# Altium schematic sheet M.2_SATA_SLOT.schdoc
size 420 x 298 mm; Symbol: Sheet-Symbol_A3; Company: 嘉立创EDA; Version: V1.0; Page Size: A3; @Project Name: 【全网首发】X86电脑主板_copy; @Page Count: 18; @Update Date: 2025-10-09; @Create Date: 2025-10-09; @Schematic Name: SCHEMATIC1_1; @Page No: 0; @Page Name: M.2_SATA_SLOT; Device: Sheet-Symbol_A3
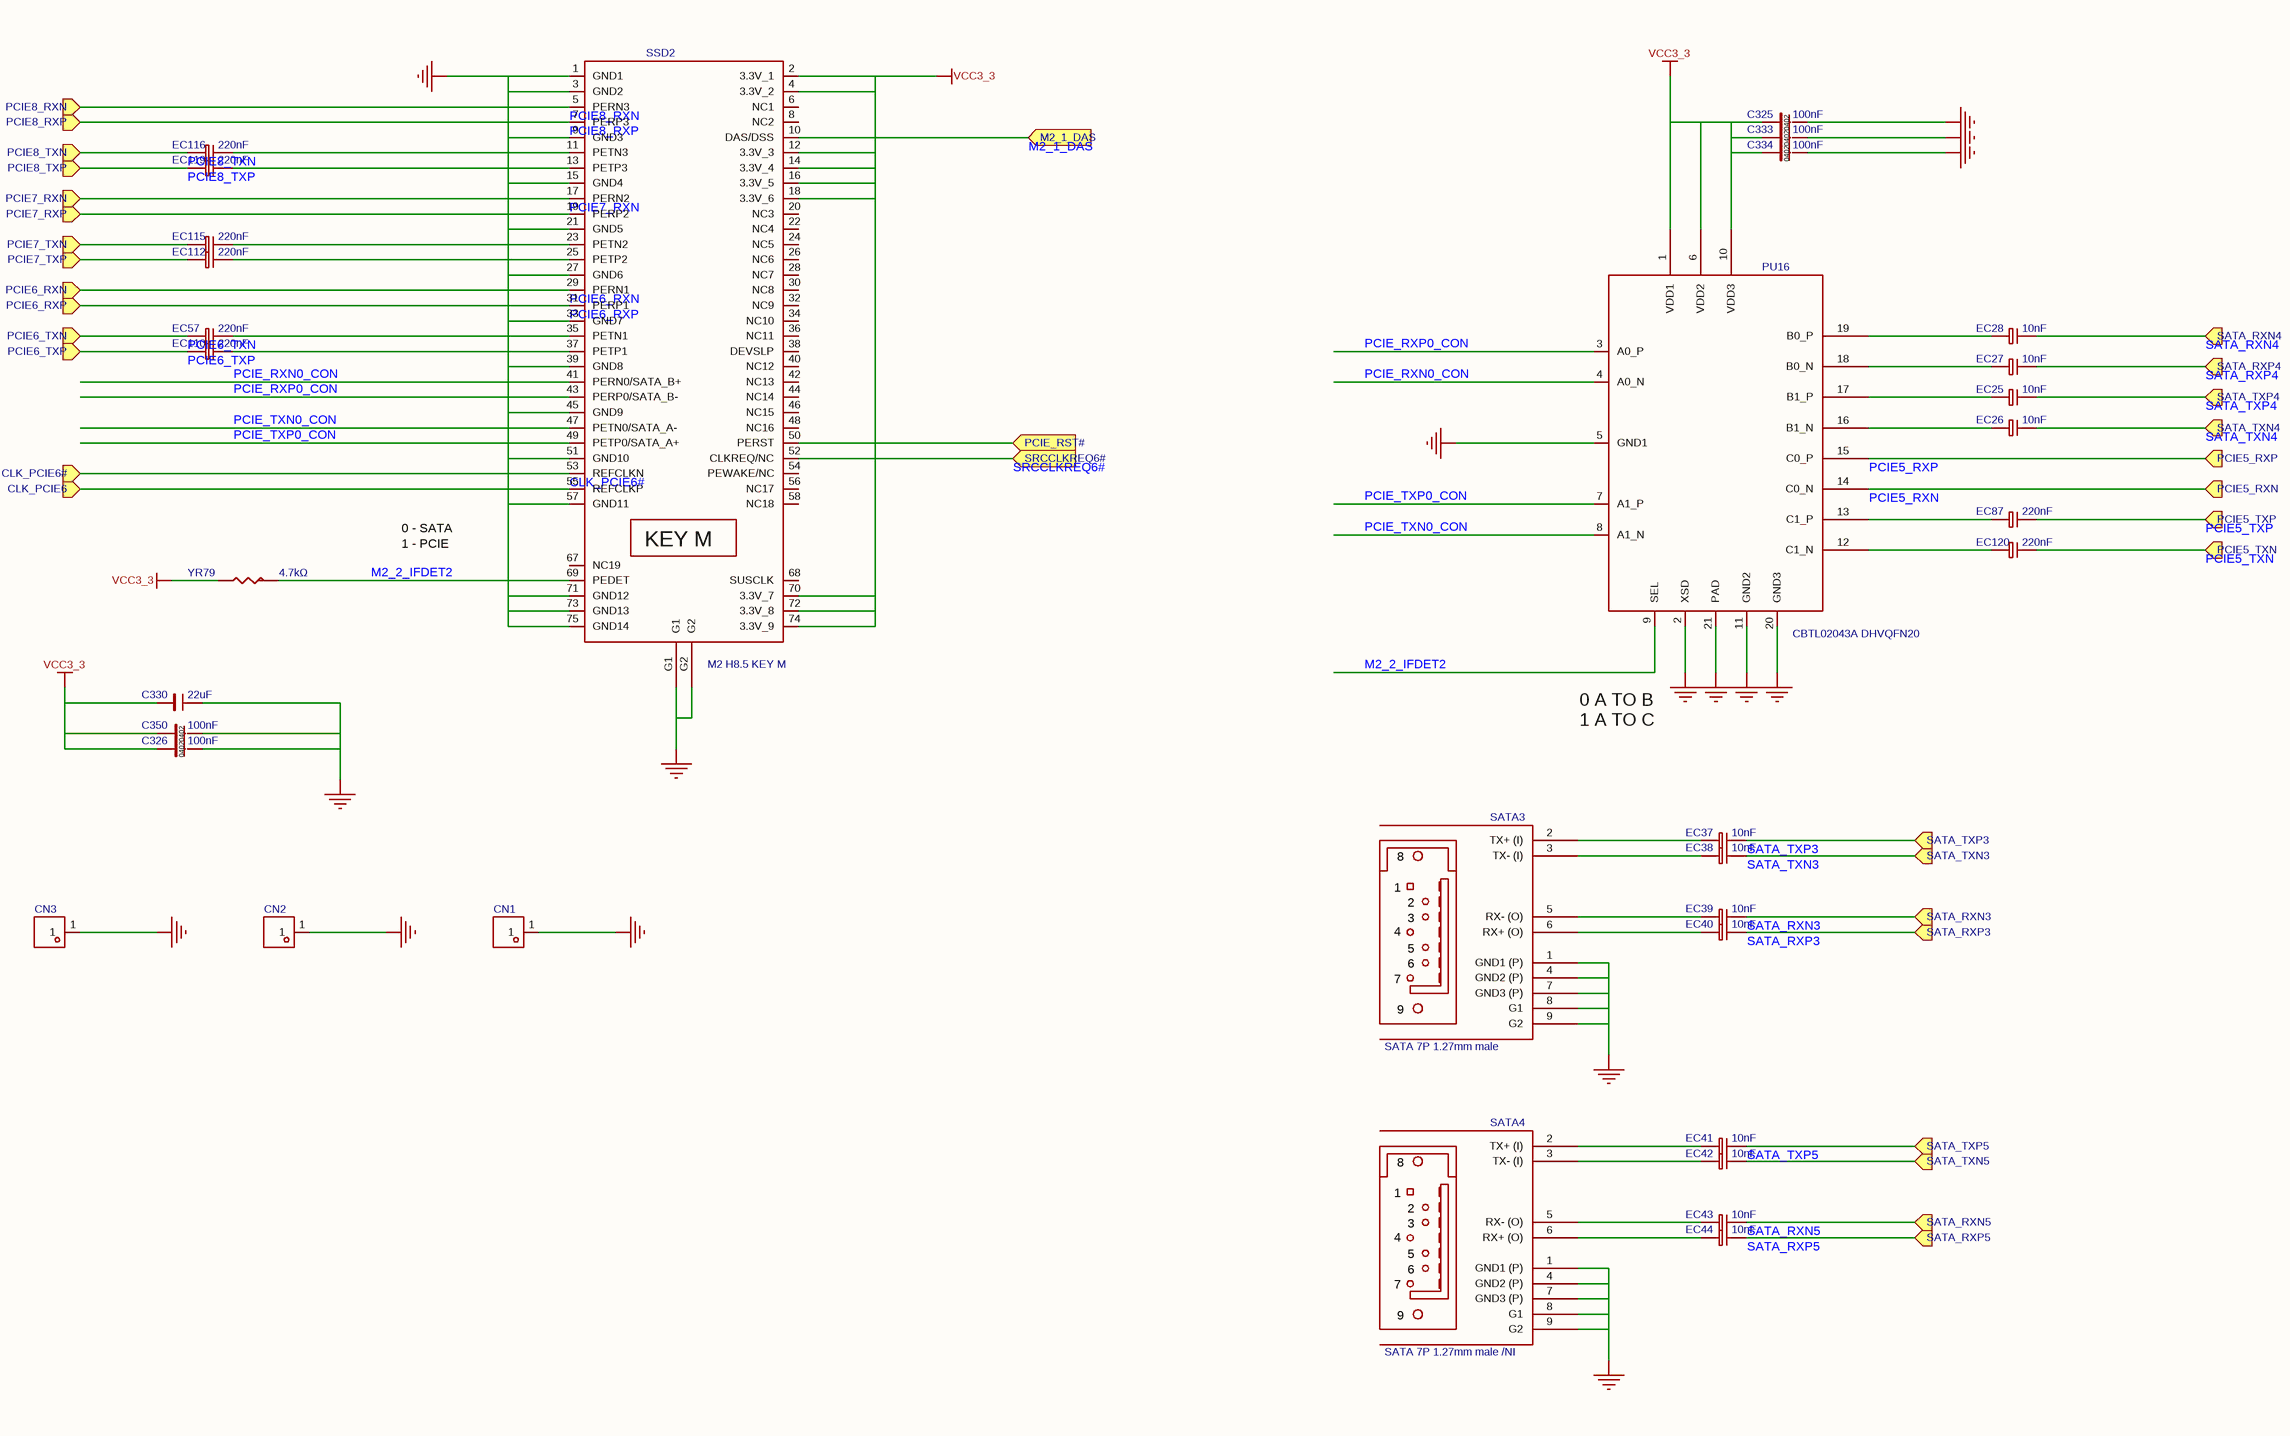
[diagram p0: M.2_SATA_SLOT.schdoc]

## Parts
C325  100nF  [C0402_1]
C326  100nF  [C0402_2]
C330  22uF  [C0603_3]
C333  100nF  [C0402_3]
C334  100nF  [C0402]
C350  100nF  [C0402_2]
CN1  SMTSOM270BTR  [SMD_BD5.6-D3.6]  (value not drawn)
CN2  SMTSOM270BTR  [SMD_BD5.6-D3.6]  (value not drawn)
CN3  SMTSOM270BTR  [SMD_BD5.6-D3.6]  (value not drawn)
EC25  10nF  [C0402_1]
EC26  10nF  [C0402_1]
EC27  10nF  [C0402_1]
EC28  10nF  [C0402_1]
EC37  10nF  [C0402_2]
EC38  10nF  [C0402_2]
EC39  10nF  [C0402_2]
EC40  10nF  [C0402_2]
EC41  10nF  [C0402_2]
EC42  10nF  [C0402_2]
EC43  10nF  [C0402_2]
EC44  10nF  [C0402_2]
EC57  220nF  [C0402_2]
EC87  220nF  [C0402_1]
EC110  220nF  [C0402_2]
EC112  220nF  [C0402_2]
EC115  220nF  [C0402_2]
EC116  220nF  [C0402_2]
EC119  220nF  [C0402_2]
EC120  220nF  [C0402_1]
PU16  value CBTL02043A DHVQFN20  [DHVQFN20]  (hidden comment: CBTL02043ABQ,115)
SATA3  value SATA 7P 1.27mm male  [SATA_D_AKL]  (hidden comment: LE18077-Z54D-4H)
SATA4  value SATA 7P 1.27mm male /NI  [SATA_D_AKL]  (hidden comment: LE18077-Z54D-4H)
SSD2  value M2 H8.5 KEY M  [SMD-NGFF-75P-M2-H3-LOTES]  (hidden comment: 91302-67-067R2M)
YR79  4.7kΩ  [R0402]

## Ports
CLK_PCIE6 (in), CLK_PCIE6# (in), M2_1_DAS (in), PCIE5_RXN (in), PCIE5_RXP (in), PCIE5_TXN (in), PCIE5_TXP (in), PCIE6_RXN (in), PCIE6_RXP (in), PCIE6_TXN (in), PCIE6_TXP (in), PCIE7_RXN (in), PCIE7_RXP (in), PCIE7_TXN (in), PCIE7_TXP (in), PCIE8_RXN (in), PCIE8_RXP (in), PCIE8_TXN (in), PCIE8_TXP (in), PCIE_RST# (in), SATA_RXN3 (in), SATA_RXN4 (in), SATA_RXN5 (in), SATA_RXP3 (in), SATA_RXP4 (in), SATA_RXP5 (in), SATA_TXN3 (in), SATA_TXN4 (in), SATA_TXN5 (in), SATA_TXP3 (in), SATA_TXP4 (in), SATA_TXP5 (in), SRCCLKREQ6# (in)

## Nets
GND: C325.2 C326.2 C330.2 C333.2 C334.2 C350.2 CN1.1 CN2.1 CN3.1 PU16.2(XSD) PU16.5(GND1) PU16.11(GND2) PU16.20(GND3) PU16.21(PAD) SATA3.1(GND1_(P)) SATA3.4(GND2_(P)) SATA3.7(GND3_(P)) SATA3.8(G1) SATA3.9(G2) SATA4.1(GND1_(P)) SATA4.4(GND2_(P)) SATA4.7(GND3_(P)) SATA4.8(G1) SATA4.9(G2) SSD2.1(GND1) SSD2.3(GND2) SSD2.9(GND3) SSD2.15(GND4) SSD2.21(GND5) SSD2.27(GND6) SSD2.33(GND7) SSD2.39(GND8) SSD2.45(GND9) SSD2.51(GND10) SSD2.57(GND11) SSD2.71(GND12) SSD2.73(GND13) SSD2.75(GND14) SSD2.G1 SSD2.G2
VCC3_3: C325.1 C326.1 C330.1 C333.1 C334.1 C350.1 PU16.1(VDD1) PU16.6(VDD2) PU16.10(VDD3) SSD2.2(3.3V_1) SSD2.4(3.3V_2) SSD2.12(3.3V_3) SSD2.14(3.3V_4) SSD2.16(3.3V_5) SSD2.18(3.3V_6) SSD2.70(3.3V_7) SSD2.72(3.3V_8) SSD2.74(3.3V_9) YR79.2
CLK_PCIE6: SSD2.55(REFCLKP) ; port CLK_PCIE6
CLK_PCIE6#: SSD2.53(REFCLKN) ; port CLK_PCIE6#
M2_1_DAS: SSD2.10(DAS/DSS) ; port M2_1_DAS
M2_2_IFDET2: PU16.9(SEL) SSD2.69(PEDET) YR79.1
PCIE5_RXN: PU16.14(C0_N) ; port PCIE5_RXN
PCIE5_RXP: PU16.15(C0_P) ; port PCIE5_RXP
PCIE5_TXN: EC120.2 ; port PCIE5_TXN
PCIE5_TXP: EC87.2 ; port PCIE5_TXP
PCIE6_RXN: SSD2.29(PERN1) ; port PCIE6_RXN
PCIE6_RXP: SSD2.31(PERP1) ; port PCIE6_RXP
PCIE6_TXN: EC57.1 ; port PCIE6_TXN
PCIE6_TXP: EC110.1 ; port PCIE6_TXP
PCIE7_RXN: SSD2.17(PERN2) ; port PCIE7_RXN
PCIE7_RXP: SSD2.19(PERP2) ; port PCIE7_RXP
PCIE7_TXN: EC115.1 ; port PCIE7_TXN
PCIE7_TXP: EC112.1 ; port PCIE7_TXP
PCIE8_RXN: SSD2.5(PERN3) ; port PCIE8_RXN
PCIE8_RXP: SSD2.7(PERP3) ; port PCIE8_RXP
PCIE8_TXN: EC116.1 ; port PCIE8_TXN
PCIE8_TXP: EC119.1 ; port PCIE8_TXP
PCIE_RST#: SSD2.50(PERST) ; port PCIE_RST#
PCIE_RXN0_CON: PU16.4(A0_N) SSD2.41(PERN0/SATA_B+)
PCIE_RXP0_CON: PU16.3(A0_P) SSD2.43(PERP0/SATA_B-)
PCIE_TXN0_CON: PU16.8(A1_N) SSD2.47(PETN0/SATA_A-)
PCIE_TXP0_CON: PU16.7(A1_P) SSD2.49(PETP0/SATA_A+)
SATA_RXN3: EC39.2 ; port SATA_RXN3
SATA_RXN4: EC28.2 ; port SATA_RXN4
SATA_RXN5: EC43.2 ; port SATA_RXN5
SATA_RXP3: EC40.2 ; port SATA_RXP3
SATA_RXP4: EC27.2 ; port SATA_RXP4
SATA_RXP5: EC44.2 ; port SATA_RXP5
SATA_TXN3: EC38.2 ; port SATA_TXN3
SATA_TXN4: EC26.2 ; port SATA_TXN4
SATA_TXN5: EC42.2 ; port SATA_TXN5
SATA_TXP3: EC37.2 ; port SATA_TXP3
SATA_TXP4: EC25.2 ; port SATA_TXP4
SATA_TXP5: EC41.2 ; port SATA_TXP5
SRCCLKREQ6#: SSD2.52(CLKREQ/NC) ; port SRCCLKREQ6#
NetEC25_1: EC25.1 PU16.17(B1_P)
NetEC26_1: EC26.1 PU16.16(B1_N)
NetEC27_1: EC27.1 PU16.18(B0_N)
NetEC28_1: EC28.1 PU16.19(B0_P)
NetEC37_1: EC37.1 SATA3.2(TX+_(I))
NetEC38_1: EC38.1 SATA3.3(TX-_(I))
NetEC39_1: EC39.1 SATA3.5(RX-_(O))
NetEC40_1: EC40.1 SATA3.6(RX+_(O))
NetEC41_1: EC41.1 SATA4.2(TX+_(I))
NetEC42_1: EC42.1 SATA4.3(TX-_(I))
NetEC43_1: EC43.1 SATA4.5(RX-_(O))
NetEC44_1: EC44.1 SATA4.6(RX+_(O))
NetEC57_2: EC57.2 SSD2.35(PETN1)
NetEC87_1: EC87.1 PU16.13(C1_P)
NetEC110_2: EC110.2 SSD2.37(PETP1)
NetEC112_2: EC112.2 SSD2.25(PETP2)
NetEC115_2: EC115.2 SSD2.23(PETN2)
NetEC116_2: EC116.2 SSD2.11(PETN3)
NetEC119_2: EC119.2 SSD2.13(PETP3)
NetEC120_1: EC120.1 PU16.12(C1_N)

Not connected (* = marked no-connect by the designer): SSD2 6(NC1) 8(NC2) 20(NC3) 22(NC4) 24(NC5) 26(NC6) 28(NC7) 30(NC8) 32(NC9) 34(NC10) 36(NC11) 38(DEVSLP) 40(NC12) 42(NC13) 44(NC14) 46(NC15) 48(NC16) 54(PEWAKE/NC) 56(NC17) 58(NC18) 67(NC19) 68(SUSCLK)

## Notes on the sheet
- 0 - SATA
- 1 - PCIE
- (near EC37) 0 A TO B
  1 A TO C
- 更新日期
- 2025-10-09
- 原理图
- 图页
- 创建日期
- 物料编码
- 审阅
- 绘制
- 【全网首发】X86电脑主板_copy
- 版本
- V1.0
- 尺寸
- A3
- 页
- 0
- 嘉立创EDA
- 共
- 18
- (in symbol 91302-67-067R2M) KEY M

## Library data of the parts
C325 C326 C333 C350 = CL05B104KO5NNNC: 容值:100nF;精度:±10%;额定电压:16V;材质(温度系数):X7R;; Manufacturer: SAMSUNG(三星); Symbol: C0402; ModelId: 36a51122f27c49738f86b3bfa98863e0; Tolerance: ±10%; AddInBom: yes; Voltage Rated: 16V; ModelName: C0402_L1.0-W0.5-H0.5; ModelTransform: 39.37,19.685,0,0,0,0,0,0,0; Temperature Coefficient: X7R; Device: CL05B104KO5NNNC; Value: 100nF; Supplier: LCSC; Datasheet: https://atta.szlcsc.com/upload/public/pdf/source/20160103/1457707674891.pdf; SupplierPart: C1525; ConvertToPcb: yes; LCSC Part Name: 100nF ±10% 16V; JLCPCB Part Class: Basic Part; ManufacturerPart: CL05B104KO5NNNC; Supplier Footprint: 0402
  C325: FootprintName: C0402_1
  C326 C350: FootprintName: C0402_2
  C333: FootprintName: C0402_3
C330 = CL10A226MQ8NRNC: 容值:22uF;精度:±20%;额定电压:6.3V;材质(温度系数):X5R;; Manufacturer: SAMSUNG(三星); Symbol: C0805; AddInBom: yes; Tolerance: ±20%; Voltage Rated: 6.3V; Temperature Coefficient: X5R; ModelId: ac125912035d415993ca9572d50418b1; ModelName: C0603_L1.6-W0.8-H0.8; ModelTransform: 62.992,31.496,0,0,0,0,0,0,0; Device: CL10A226MQ8NRNC; Value: 22uF; LCSC Part Name: 22uF ±20% 6.3V; SupplierPart: C59461; ManufacturerPart: CL10A226MQ8NRNC; Supplier Footprint: 0603; JLCPCB Part Class: Basic Part; Datasheet: https://atta.szlcsc.com/upload/public/pdf/source/20160218/1457707763339.pdf; Supplier: LCSC; ConvertToPcb: yes; FootprintName: C0603_3
C334 = CL05B104KO5NNNC: 容值:100nF;精度:±10%;额定电压:16V;材质(温度系数):X7R;; Manufacturer: SAMSUNG(三星); ModelId: 36a51122f27c49738f86b3bfa98863e0; Tolerance: ±10%; AddInBom: yes; Voltage Rated: 16V; ModelName: C0402_L1.0-W0.5-H0.5; ModelTransform: 39.37,19.685,0,0,0,0,0,0,0; Temperature Coefficient: X7R; Device: CL05B104KO5NNNC; Symbol: C0402; Value: 100nF; Supplier: LCSC; Datasheet: https://atta.szlcsc.com/upload/public/pdf/source/20160103/1457707674891.pdf; FootprintName: C0402; SupplierPart: C1525; ConvertToPcb: yes; LCSC Part Name: 100nF ±10% 16V; JLCPCB Part Class: Basic Part; ManufacturerPart: CL05B104KO5NNNC; Supplier Footprint: 0402
CN1-CN3 = SMTSOM270BTR: Manufacturer: YIYUAN(怡远); AddInBom: yes; ModelId: 61ebfd53fc244f4ca2ca3f0eff083064; ModelTransform: 218.6896,218.87854,0,0,0,0,0,0,-60.2361; Symbol: SMTSOM270BTR; Device: SMTSOM270BTR; LCSC Part Name: YIYUAN(怡远)M2 贴片螺母 L=7mm铜镀锡SMTSOM270BTR; SupplierPart: C5301781; ManufacturerPart: SMTSOM270BTR; Supplier Footprint: M2; JLCPCB Part Class: Extended Part; Datasheet: https://atta.szlcsc.com/upload/public/pdf/source/20230202/A42D22DA7D93D728E13784C4003E4077.pdf; Supplier: LCSC; ConvertToPcb: yes; FootprintName: SMD_BD5.6-D3.6; ModelName: SMD_BD5.6-D3.6
EC25-EC28 EC37-EC44 = CL05B103KB5NNNC: 容值:10nF;精度:±10%;额定电压:50V;材质(温度系数):X7R;; Manufacturer: SAMSUNG(三星); Symbol: CAP_3; ModelId: 36a51122f27c49738f86b3bfa98863e0; Tolerance: ±10%; AddInBom: yes; Voltage Rated: 50V; ModelName: C0402_L1.0-W0.5-H0.5; ModelTransform: 39.37,19.685,0,0,0,0,0,0,0; Temperature Coefficient: X7R; Device: CL05B103KB5NNNC; Value: 10nF; Supplier: LCSC; Datasheet: https://atta.szlcsc.com/upload/public/pdf/source/20160103/1457707674468.pdf; SupplierPart: C15195; ConvertToPcb: yes; LCSC Part Name: 10nF ±10% 50V; JLCPCB Part Class: Basic Part; ManufacturerPart: CL05B103KB5NNNC; Supplier Footprint: 0402
  EC25-EC28: FootprintName: C0402_1
  EC37-EC44: FootprintName: C0402_2
EC57 EC87 EC110 EC112 EC115 EC116 EC119 EC120 = CL05B224KO5NNNC: 容值:220nF;精度:±10%;额定电压:16V;材质(温度系数):X7R;; Manufacturer: SAMSUNG(三星); Symbol: CAP_3; ModelId: 36a51122f27c49738f86b3bfa98863e0; Tolerance: ±10%; AddInBom: yes; Voltage Rated: 16V; ModelName: C0402_L1.0-W0.5-H0.5; ModelTransform: 39.37,19.685,0,0,0,0,0,0,0; Temperature Coefficient: X7R; Device: CL05B224KO5NNNC; Value: 220nF; Supplier: LCSC; Datasheet: https://atta.szlcsc.com/upload/public/pdf/source/20160103/1457707689724.pdf; SupplierPart: C16772; ConvertToPcb: yes; LCSC Part Name: 220nF ±10% 16V; JLCPCB Part Class: Basic Part; ManufacturerPart: CL05B224KO5NNNC; Supplier Footprint: 0402
  EC57 EC110 EC112 EC115 EC116 EC119: FootprintName: C0402_2
  EC87 EC120: FootprintName: C0402_1
PU16 = CBTL02043ABQ,115: 通道数:2;; Manufacturer: NXP(恩智浦); Symbol: RT9173B_1; AddInBom: yes; ModelId: 918c0b6f6ee34a00ac61cad91f9c3b79; ModelName: DHVQFN-20_L4.5-W2.5-H1.0-P0.50; ModelTransform: 177.952,99.2124,0,0,0,0,0,0,0; Number of Channels: 2; Supply Voltage: 3V~3.6V; Device: CBTL02043ABQ,115; LCSC Part Name: CBTL02043ABQ,115; SupplierPart: C2652457; ManufacturerPart: CBTL02043ABQ,115; Supplier Footprint: DHVQFN-20(2.5x4.5); JLCPCB Part Class: Extended Part; Datasheet: https://atta.szlcsc.com/upload/public/pdf/source/20210610/90394DED433530325F9420CC6CAD8C68.pdf; Supplier: LCSC; ConvertToPcb: yes; FootprintName: DHVQFN20
SATA3 SATA4 = LE18077-Z54D-4H: 连接器类型:SATA;间距:1.27mm;引脚总数:7P;安装方式:直插;工作温度范围:-;; Manufacturer: FOXCONN(富士康); Symbol: CON_SATA_0; AddInBom: yes; ModelId: 0436eca5925c4476b8c12039190a48c8; ModelName: CONN-TH_LE18077-Z54D-4H; ModelTransform: 664.5656,253.9365,0,0,0,0,2.126,-29.529,-137.795; Connector Type: SATA; Pitch: 1.27mm; Device: LE18077-Z54D-4H; JLCPCB Part Class: Extended Part; LCSC Part Name: 1.27mm P数:7P; SupplierPart: C2760977; ManufacturerPart: LE18077-Z54D-4H; Supplier Footprint: 插件,P=1.27mm; Datasheet: https://atta.szlcsc.com/upload/public/pdf/source/20210311/C2760977_52C78B253FD0431A57C5EE5E2D3B95F9.pdf; Supplier: LCSC; ConvertToPcb: yes; FootprintName: SATA_D_AKL; Number of Pins: 7P; Mounting Style: 直插; Height Above Board: 8.4mm; Operating Temperature Range: -
SSD2 = 91302-67-067R2M: 连接器类型:M.2;间距:0.5mm;引脚总数:67P;安装方式:卧贴;工作温度范围:-40℃~+80℃;; Manufacturer: UMaxconn(友贸); Symbol: NGFF-M_0; AddInBom: yes; ModelId: 59b61bd22b3246afa28dfa3f08f936f5; ModelName: PCIE-M-KEY_91302-67-067R2M; ModelTransform: 860.628,280.3144,0,0,0,0,0,9.842,-19.685; Connector Type: M.2; Pitch: 0.5mm; Device: 91302-67-067R2M; LCSC Part Name: 0.5mm P数:67P; SupplierPart: C2922445; ManufacturerPart: 91302-67-067R2M; Supplier Footprint: SMD,P=0.5mm,卧贴; JLCPCB Part Class: Extended Part; Datasheet: https://atta.szlcsc.com/upload/public/pdf/source/20211119/A0E352E9B49FDCBBE6601CEA31B5A16F.pdf; Supplier: LCSC; ConvertToPcb: yes; FootprintName: SMD-NGFF-75P-M2-H3-LOTES; Number of Pins: 67P; Mounting Style: 卧贴; Height Above Board: 6.7mm; Contact Material: 铜合金; Contact Plating: 金; Operating Temperature Range: -40℃~+80℃
YR79 = 0402WGF4701TCE: 电阻类型:厚膜电阻;阻值:4.7kΩ;精度:±1%;功率:62.5mW;; Manufacturer: UNI-ROYAL(厚声); Symbol: R-0603; ModelId: 671aefced39d4c318694bba8bd8efd39; Tolerance: ±1%; AddInBom: yes; Power(Watts): 62.5mW; ModelName: R0402_L1.0-W0.5-H0.5; ModelTransform: 39.37,19.685,0,0,0,0,0,0.0005,0; Overload Voltage (Max): 50V; Temperature Coefficient: ±100ppm/℃; Device: 0402WGF4701TCE; Value: 4.7kΩ; Type: 厚膜电阻; Supplier: LCSC; Datasheet: https://atta.szlcsc.com/upload/public/pdf/source/20200306/C422600_1E6D84923E4A46A82E41ADD87F860B5C.pdf; FootprintName: R0402; SupplierPart: C25900; ConvertToPcb: yes; LCSC Part Name: 4.7kΩ ±1% 62.5mW; JLCPCB Part Class: Basic Part; ManufacturerPart: 0402WGF4701TCE; Supplier Footprint: 0402; Operating Temperature Range: -55℃~+155℃